# EAGLE board mbc_90_23_11_25_dc (EAGLE 7.6.0)
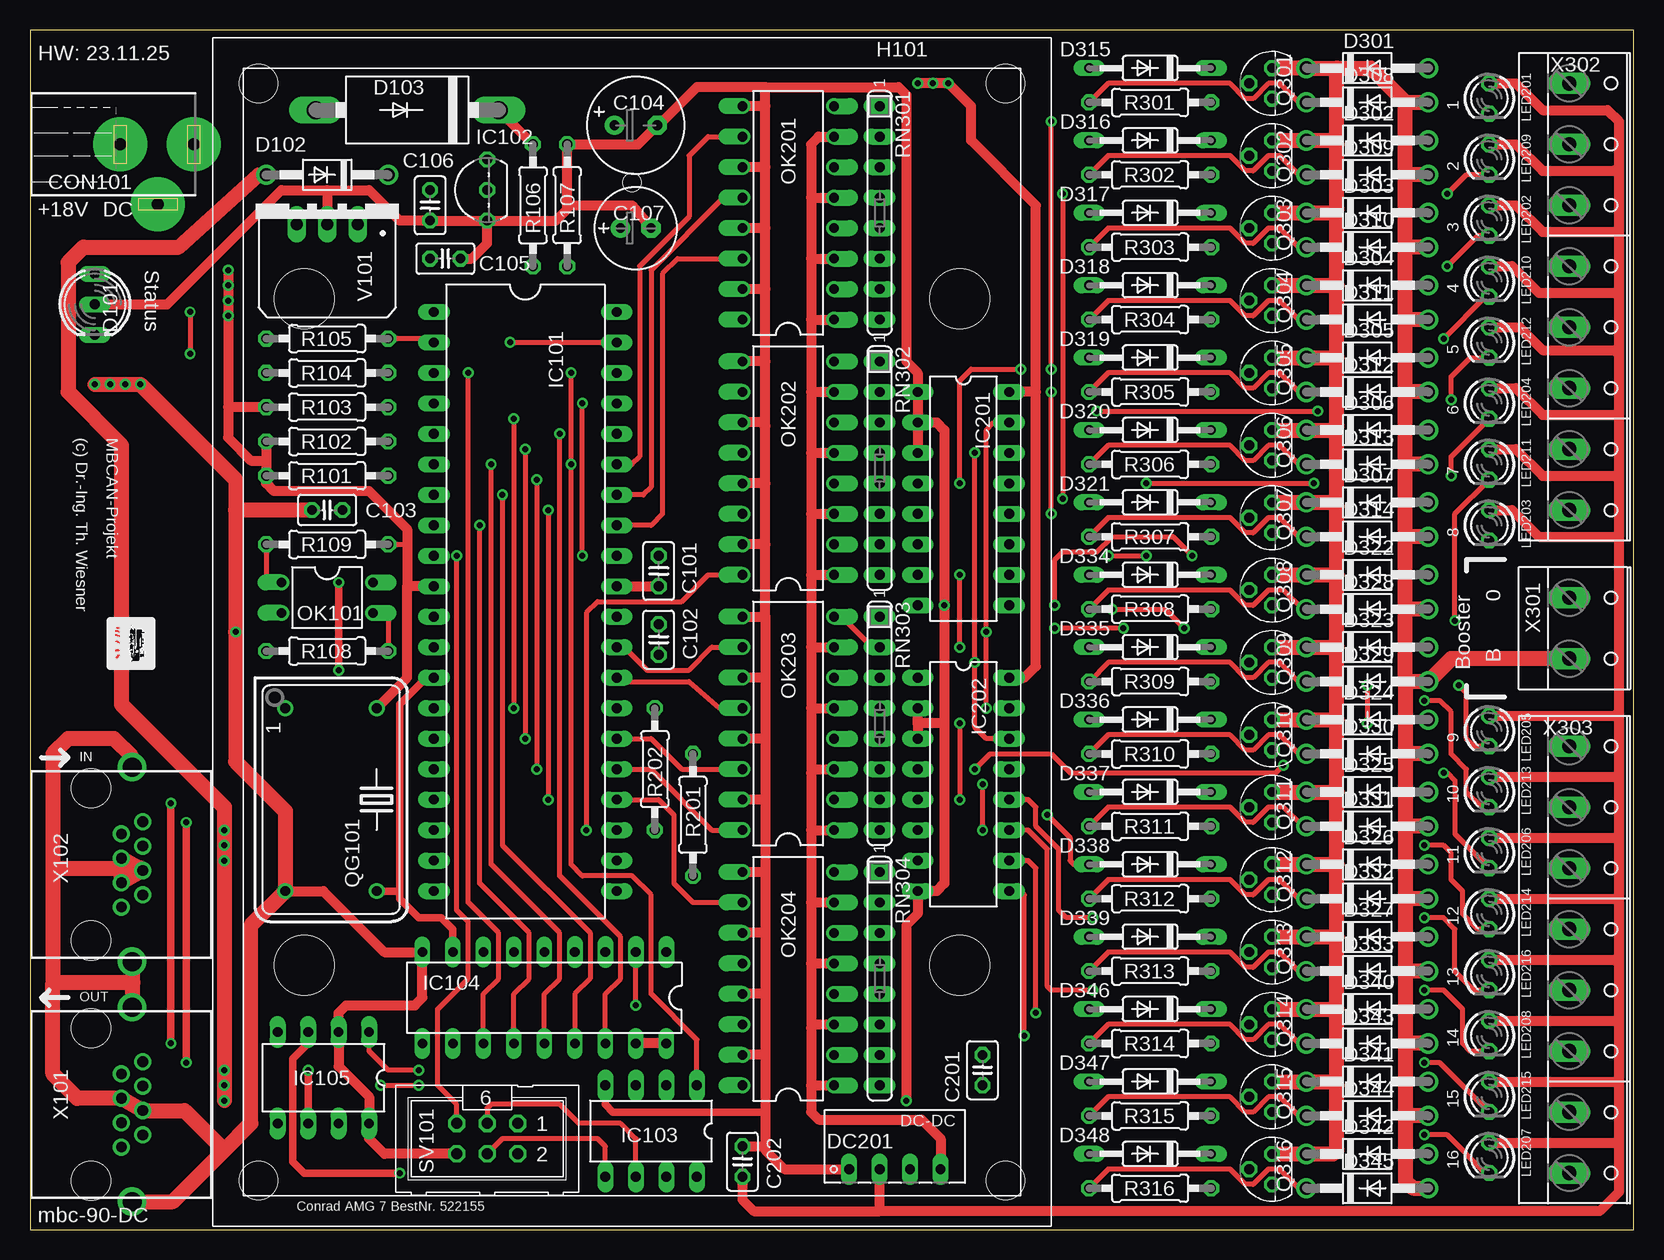
[diagram p3: board, top side]
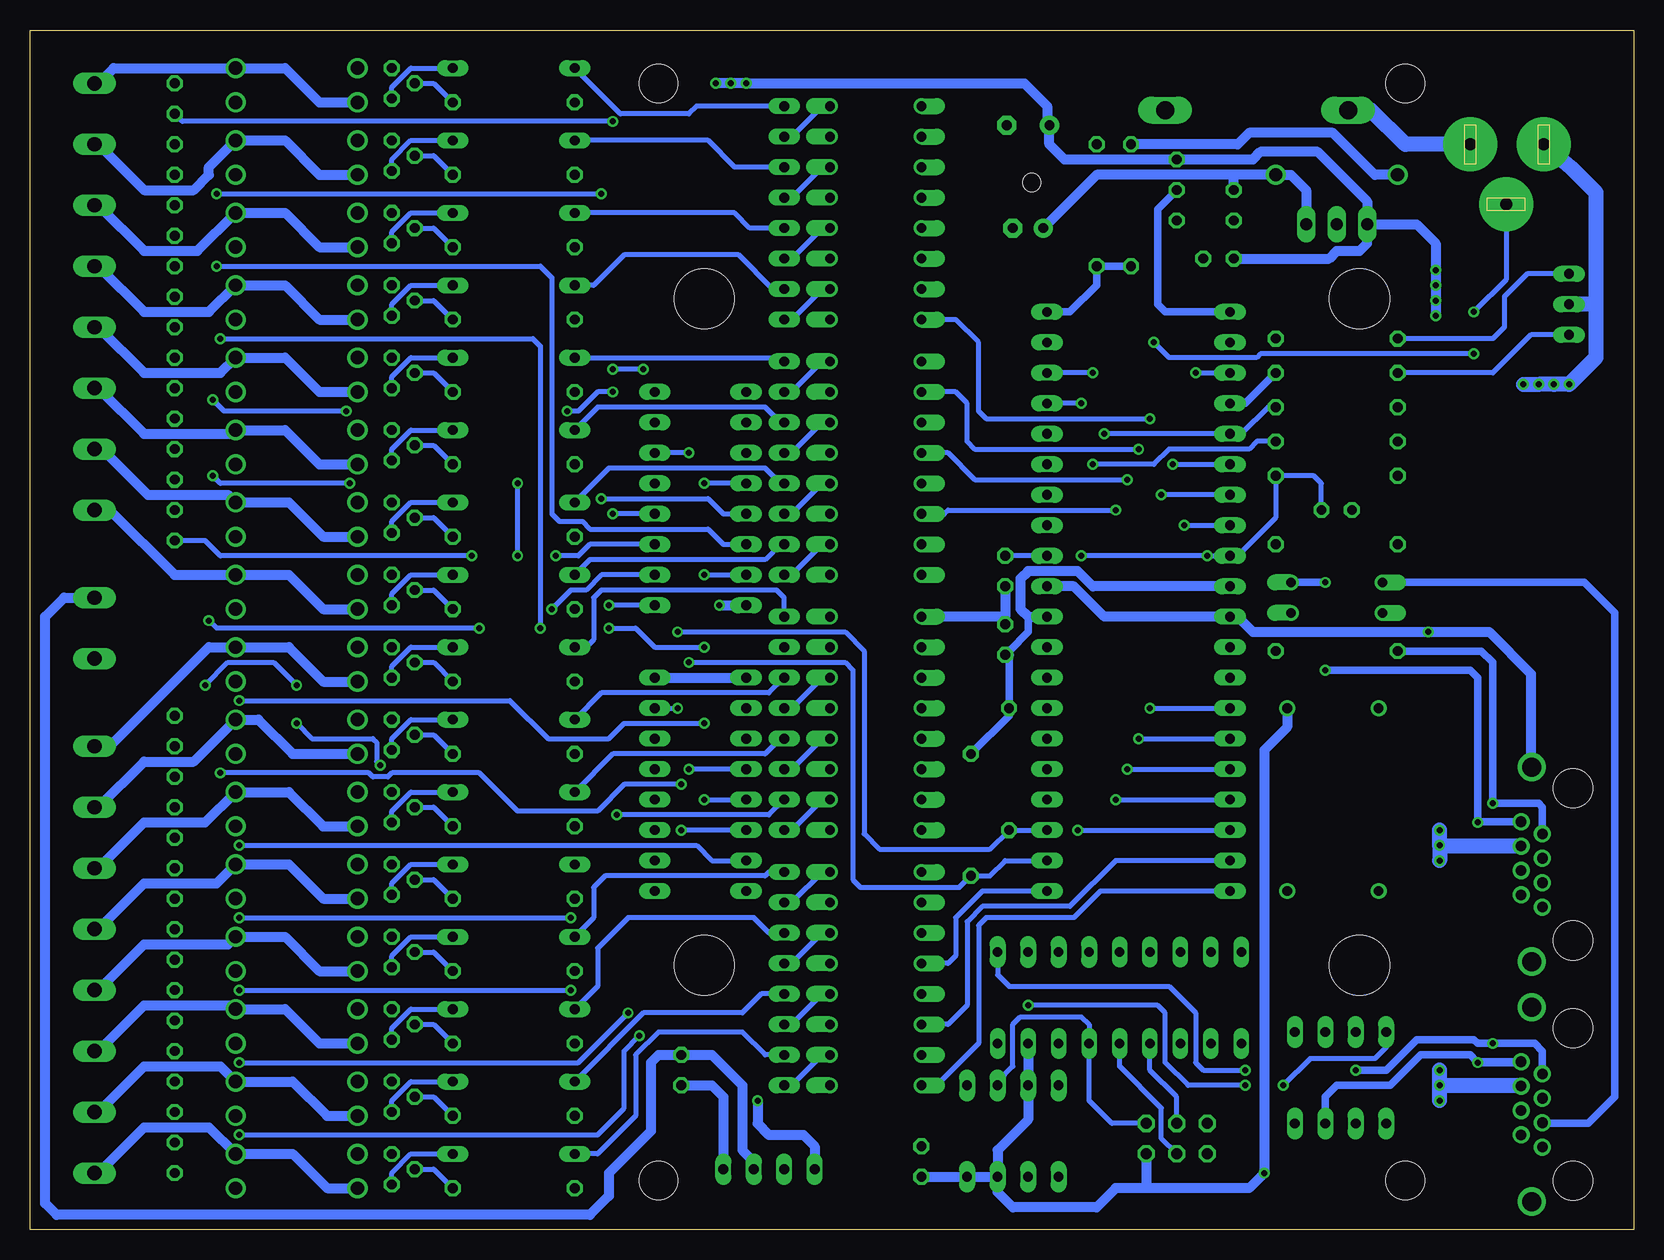
[diagram p4: board, bottom side, seen from below]

Size 133.66 x 99.99 mm. Coordinates in mm from the lower left corner, seen from the top.
Outline: 0,99.99 0,0 133.66,0 133.66,99.99 0,99.99
Copper layers (1*16): Top 0.035mm / dielectric 1.5mm / Bottom 0.035mm
Design rules "default *": minimum track width 10mil, minimum drill 0.5mm, track to track 8mil, track to pad 8mil, pad to pad 8mil, via to via 8mil, smd to smd 8mil, copper to edge 40mil, drill to drill 8mil, minimum pad ring 10mil, minimum via ring 8mil, stop-mask expansion 4mil, vias tented up to drill 0mil, thermal gap 10mil

## Footprints (pad centres in the part's own frame; a part is rotated, then mirrored left to right if it is on the bottom)
C025-025X050 = drill 0.813 octagon: 1 -1.27,0; 2 1.27,0
E3,5-8 = drill 0.813 pad 1.6: + -1.778,0 | drill 0.813 pad 1.6 octagon: - 1.778,0
E2,5-7 = drill 0.813 pad 1.6: + -1.27,0 | drill 0.813 pad 1.6 octagon: - 1.27,0
POWER-JACK = drill 1 pad 4.5: 1 0,6.03; 2 0,-0.12; 3 5,3.03
DUOLED5MM = drill 0.813 long: AG -2.54,0; AR 2.54,0; K 0,0
DO41-10 = drill 1.118: A 5.08,0; C -5.08,0
DO201-15 = drill 1.499 long: A 7.62,0; C -7.62,0
DO35-10 = drill 0.813 long: A 5.08,0; C -5.08,0
NME = drill 0.813 long: 1 0,3.81; 2 0,1.27; 3 0,-1.27; 4 0,-3.81
MODULGEHÄUSE-1 = hole 3.2: -45.72,-31.115; -45.72,31.115; 45.72,31.115; 45.72,-31.115 | hole 5: -27.781,-27.305; 27.781,-27.305; -27.781,27.305; 27.781,27.305 | hole 1.5: -37.465,0
DIL40 = drill 0.813 long: 1 -24.13,-7.62; 2 -21.59,-7.62; 3 -19.05,-7.62; 4 -16.51,-7.62; 5 -13.97,-7.62; 6 -11.43,-7.62; 7 -8.89,-7.62; 8 -6.35,-7.62; 9 -3.81,-7.62; 10 -1.27,-7.62; 11 1.27,-7.62; 12 3.81,-7.62; 13 6.35,-7.62; 14 8.89,-7.62; 15 11.43,-7.62; 16 13.97,-7.62; 17 16.51,-7.62; 18 19.05,-7.62; 19 21.59,-7.62; 20 24.13,-7.62; 21 24.13,7.62; 22 21.59,7.62; 23 19.05,7.62; 24 16.51,7.62; 25 13.97,7.62; 26 11.43,7.62; 27 8.89,7.62; 28 6.35,7.62; 29 3.81,7.62; 30 1.27,7.62; 31 -1.27,7.62; 32 -3.81,7.62; 33 -6.35,7.62; 34 -8.89,7.62; 35 -11.43,7.62; 36 -13.97,7.62; 37 -16.51,7.62; 38 -19.05,7.62; 39 -21.59,7.62; 40 -24.13,7.62
TO92- = drill 0.813 octagon: 1 -2.54,0; 2 0,0; 3 2.54,0
DIL8 = drill 0.813 long: 1 -3.81,-3.81; 2 -1.27,-3.81; 3 1.27,-3.81; 4 3.81,-3.81; 5 3.81,3.81; 6 1.27,3.81; 7 -1.27,3.81; 8 -3.81,3.81
DIL18 = drill 0.813 long: 1 -10.16,-3.81; 2 -7.62,-3.81; 3 -5.08,-3.81; 4 -2.54,-3.81 | drill 0.8 long: 5 0,-3.81; 6 2.54,-3.81; 7 5.08,-3.81; 8 7.62,-3.81; 9 10.16,-3.81; 10 10.16,3.81; 11 7.62,3.81; 12 5.08,3.81; 13 2.54,3.81; 14 0,3.81; 15 -2.54,3.81; 16 -5.08,3.81; 17 -7.62,3.81; 18 -10.16,3.81
DIL08 = drill 0.813 long: 1 -3.81,-3.81; 2 -1.27,-3.81; 3 1.27,-3.81; 4 3.81,-3.81; 5 3.81,3.81; 6 1.27,3.81; 7 -1.27,3.81; 8 -3.81,3.81
DIL16 = drill 0.813 long: 1 -8.89,-3.81; 2 -6.35,-3.81; 3 -3.81,-3.81; 4 -1.27,-3.81; 5 1.27,-3.81; 6 3.81,-3.81; 7 6.35,-3.81; 8 8.89,-3.81; 9 8.89,3.81; 10 6.35,3.81; 11 3.81,3.81; 12 1.27,3.81; 13 -1.27,3.81; 14 -3.81,3.81; 15 -6.35,3.81; 16 -8.89,3.81
LED3MM = drill 0.813 octagon: A -1.27,0; K 1.27,0
DIL04 = drill 0.813 offset: 1 -1.27,-3.81; 2 1.27,-3.81; 3 1.27,3.81; 4 -1.27,3.81
DIL16' = drill 0.813 offset: 1 -8.89,-3.81; 2 -6.35,-3.81; 3 -3.81,-3.81; 4 -1.27,-3.81; 5 1.27,-3.81; 6 3.81,-3.81; 7 6.35,-3.81; 8 8.89,-3.81; 9 8.89,3.81; 10 6.35,3.81; 11 3.81,3.81; 12 1.27,3.81; 13 -1.27,3.81; 14 -3.81,3.81; 15 -6.35,3.81; 16 -8.89,3.81
TO92 = drill 0.813 octagon: 1 1.27,0; 2 0,1.905; 3 -1.27,0
DIL14S = drill 0.813: 1 -7.62,-3.81; 7 7.62,-3.81; 8 7.62,3.81; 14 -7.62,3.81
0207/10 = drill 0.813 octagon: 1 -5.08,0; 2 5.08,0
SIL8 = drill 0.813 long: 1 -8.89,0; 2 -6.35,0; 3 -3.81,0; 4 -1.27,0; 5 1.27,0; 6 3.81,0; 7 6.35,0; 8 8.89,0
ML6 = drill 0.914 octagon: 1 -2.54,-1.27; 2 -2.54,1.27; 3 0,-1.27; 4 0,1.27; 5 2.54,-1.27; 6 2.54,1.27
TRACO-TSR-1 = drill 1.016 long: GND 0,2.54; IN -2.54,2.54; OUT 2.54,2.54
0446200002 = drill 0.889 pad 1.422: 1 3.556,2.54; 2 2.54,4.318; 3 1.524,2.54; 4 0.508,4.318; 5 -0.508,2.54; 6 -1.524,4.318; 7 -2.54,2.54; 8 -3.556,4.318 | drill 1.575 pad 2.286: S@1 -8.103,3.429; S@2 8.103,3.429 | hole 3.251: 6.35,0; -6.35,0
W237-132 = drill 1.194 long: 1 -2.54,-0.635; 2 2.54,-0.635
W237-8P = drill 1.194 long: 1 -17.78,-0.635; 2 -12.7,-0.635; 3 -7.62,-0.635; 4 -2.54,-0.635; 5 2.54,-0.635; 6 7.62,-0.635; 7 12.7,-0.635; 8 17.78,-0.635

## Placement (x,y rotation side)
C101  100n  [C025-025X050]  52.39,54.91 270 top
C102  100n  [C025-025X050]  52.39,49.19 90 top
C103  100n  [C025-025X050]  24.77,59.99 180 top
C104  470u/16V  [E3,5-8]  50.48,92.06 0 top
C105  100n  [C025-025X050]  34.61,80.94 0 top
C106  100n  [C025-025X050]  33.34,85.39 270 top
C107  47u/35V  [E2,5-7]  50.48,83.48 0 top
C201  100n  [C025-025X050]  79.38,13.32 90 top
C202  100n  [C025-025X050]  59.37,5.7 90 top
CON101  [POWER-JACK]  7.62,90.47 270 top
D101  Status  [DUOLED5MM]  5.4,77.13 270 top
D102  1N4004  [DO41-10]  24.77,87.93 180 top
D103  1N5400  [DO201-15]  31.43,93.33 180 top
D301  1N4001  [DO41-10]  111.44,96.82 0 top
D302  1N4001  [DO41-10]  111.44,90.79 0 top
D303  1N4001  [DO41-10]  111.44,84.75 0 top
D304  1N4001  [DO41-10]  111.44,78.72 0 top
D305  1N4001  [DO41-10]  111.44,72.69 0 top
D306  1N4001  [DO41-10]  111.44,66.66 0 top
D307  1N4001  [DO41-10]  111.44,60.62 0 top
D308  1N4001  [DO41-10]  111.44,93.96 0 top
D309  1N4001  [DO41-10]  111.44,87.93 0 top
D310  1N4001  [DO41-10]  111.44,81.9 0 top
D311  1N4001  [DO41-10]  111.44,75.86 0 top
D312  1N4001  [DO41-10]  111.44,69.83 0 top
D313  1N4001  [DO41-10]  111.44,63.8 0 top
D314  1N4001  [DO41-10]  111.44,57.76 0 top
D315  1N4148  [DO35-10]  93.34,96.82 180 top
D316  1N4148  [DO35-10]  93.34,90.79 180 top
D317  1N4148  [DO35-10]  93.34,84.75 180 top
D318  1N4148  [DO35-10]  93.34,78.72 180 top
D319  1N4148  [DO35-10]  93.34,72.69 180 top
D320  1N4148  [DO35-10]  93.34,66.66 180 top
D321  1N4148  [DO35-10]  93.34,60.62 180 top
D322  1N4001  [DO41-10]  111.44,54.59 0 top
D323  1N4001  [DO41-10]  111.44,48.56 0 top
D324  1N4001  [DO41-10]  111.44,42.52 0 top
D325  1N4001  [DO41-10]  111.44,36.49 0 top
D326  1N4001  [DO41-10]  111.44,30.46 0 top
D327  1N4001  [DO41-10]  111.44,24.43 0 top
D328  1N4001  [DO41-10]  111.44,51.73 0 top
D329  1N4001  [DO41-10]  111.44,45.7 0 top
D330  1N4001  [DO41-10]  111.44,39.67 0 top
D331  1N4001  [DO41-10]  111.44,33.63 0 top
D332  1N4001  [DO41-10]  111.44,27.6 0 top
D333  1N4001  [DO41-10]  111.44,21.57 0 top
D334  1N4148  [DO35-10]  93.34,54.59 180 top
D335  1N4148  [DO35-10]  93.34,48.56 180 top
D336  1N4148  [DO35-10]  93.34,42.52 180 top
D337  1N4148  [DO35-10]  93.34,36.49 180 top
D338  1N4148  [DO35-10]  93.34,30.46 180 top
D339  1N4148  [DO35-10]  93.34,24.43 180 top
D340  1N4001  [DO41-10]  111.44,18.39 0 top
D341  1N4001  [DO41-10]  111.44,12.36 0 top
D342  1N4001  [DO41-10]  111.44,6.33 0 top
D343  1N4001  [DO41-10]  111.44,15.54 0 top
D344  1N4001  [DO41-10]  111.44,9.51 0 top
D345  1N4001  [DO41-10]  111.44,3.47 0 top
D346  1N4148  [DO35-10]  93.34,18.39 180 top
D347  1N4148  [DO35-10]  93.34,12.36 180 top
D348  1N4148  [DO35-10]  93.34,6.33 180 top
DC201  NKE0505  [NME]  72.07,5.06 90 top
H101  [MODULGEHÄUSE-1]  50.16,49.83 270 top
IC101  MEGA644-P  [DIL40]  41.27,52.37 270 top
IC102  DS1820  [TO92-]  38.1,86.66 90 top
IC103  25LC10240P  [DIL8]  51.75,8.24 180 top
IC104  MCP2515-I/P  [DIL18]  42.86,19.35 180 top
IC105  PCA82C250  [DIL08]  24.45,12.68 180 top
IC201  PCF8574P  [DIL16]  77.79,60.94 270 top
IC202  PCF8574P  [DIL16]  77.79,37.13 270 top
LED201  Gelb 5V 3mm  [LED3MM]  121.6,94.28 270 top
LED202  Gelb 5V 3mm  [LED3MM]  121.6,84.12 270 top
LED203  Gelb 5V 3mm  [LED3MM]  121.6,58.72 270 top
LED204  Gelb 5V 3mm  [LED3MM]  121.6,68.88 270 top
LED205  Gelb 5V 3mm  [LED3MM]  121.6,41.57 270 top
LED206  Gelb 5V 3mm  [LED3MM]  121.6,31.41 270 top
LED207  Gelb 5V 3mm  [LED3MM]  121.6,6.01 270 top
LED208  Gelb 5V 3mm  [LED3MM]  121.6,16.17 270 top
LED209  Gelb 5V 3mm  [LED3MM]  121.6,89.2 270 top
LED210  Gelb 5V 3mm  [LED3MM]  121.6,79.04 270 top
LED211  Gelb 5V 3mm  [LED3MM]  121.6,63.8 270 top
LED212  Gelb 5V 3mm  [LED3MM]  121.6,73.96 270 top
LED213  Gelb 5V 3mm  [LED3MM]  121.6,36.49 270 top
LED214  Gelb 5V 3mm  [LED3MM]  121.6,26.33 270 top
LED215  Gelb 5V 3mm  [LED3MM]  121.6,11.09 270 top
LED216  Gelb 5V 3mm  [LED3MM]  121.6,21.25 270 top
OK101  PC814  [DIL04]  24.77,52.68 270 top
OK201  PC 847X  [DIL16']  63.18,84.75 90 top
OK202  PC 847X  [DIL16']  63.18,63.48 90 top
OK203  PC 847X  [DIL16']  63.18,42.21 90 top
OK204  PC 847X  [DIL16']  63.18,20.93 90 top
Q301  BC547A  [TO92]  103.5,95.55 90 top
Q302  BC547A  [TO92]  103.5,89.52 90 top
Q303  BC547A  [TO92]  103.5,83.48 90 top
Q304  BC547A  [TO92]  103.5,77.45 90 top
Q305  BC547A  [TO92]  103.5,71.42 90 top
Q306  BC547A  [TO92]  103.5,65.39 90 top
Q307  BC547A  [TO92]  103.5,59.35 90 top
Q308  BC547A  [TO92]  103.5,53.32 90 top
Q309  BC547A  [TO92]  103.5,47.29 90 top
Q310  BC547A  [TO92]  103.5,41.25 90 top
Q311  BC547A  [TO92]  103.5,35.22 90 top
Q312  BC547A  [TO92]  103.5,29.19 90 top
Q313  BC547A  [TO92]  103.5,23.16 90 top
Q314  BC547A  [TO92]  103.5,17.12 90 top
Q315  BC547A  [TO92]  103.5,11.09 90 top
Q316  BC547A  [TO92]  103.5,5.06 90 top
QG101  16 MHz  [DIL14S]  25.08,35.86 270 top
R101  10k  [0207/10]  24.77,62.84 180 top
R102  10k  [0207/10]  24.77,65.7 180 top
R103  10k  [0207/10]  24.77,68.56 180 top
R104  390R  [0207/10]  24.77,71.42 180 top
R105  390R  [0207/10]  24.77,74.28 180 top
R106  9k/0,1%  [0207/10]  41.91,85.39 270 top
R107  1k/0,1%  [0207/10]  44.77,85.39 90 top
R108  120R  [0207/10]  24.77,48.24 180 top
R109  390R  [0207/10]  24.77,57.13 180 top
R201  4k7  [0207/10]  55.24,34.59 90 top
R202  4k7  [0207/10]  52.07,38.4 90 top
R301  1k  [0207/10]  93.34,93.96 0 top
R302  1k  [0207/10]  93.34,87.93 0 top
R303  1k  [0207/10]  93.34,81.9 0 top
R304  1k  [0207/10]  93.34,75.86 0 top
R305  1k  [0207/10]  93.34,69.83 0 top
R306  1k  [0207/10]  93.34,63.8 0 top
R307  1k  [0207/10]  93.34,57.76 0 top
R308  1k  [0207/10]  93.34,51.73 0 top
R309  1k  [0207/10]  93.34,45.7 0 top
R310  1k  [0207/10]  93.34,39.67 0 top
R311  1k  [0207/10]  93.34,33.63 0 top
R312  1k  [0207/10]  93.34,27.6 0 top
R313  1k  [0207/10]  93.34,21.57 0 top
R314  1k  [0207/10]  93.34,15.54 0 top
R315  1k  [0207/10]  93.34,9.51 0 top
R316  1k  [0207/10]  93.34,3.47 0 top
RN301  10k  [SIL8]  70.8,84.75 270 top
RN302  10k  [SIL8]  70.8,63.48 270 top
RN303  10k  [SIL8]  70.8,42.21 270 top
RN304  10k  [SIL8]  70.8,20.93 270 top
SV101  [ML6]  38.1,7.6 180 top
V101  TSR-1  [TRACO-TSR-1]  24.77,86.34 180 top
X101  OUT  [0446200002]  5.08,10.46 270 top
X102  IN  [0446200002]  5.08,30.46 270 top
X301  [W237-132]  128.91,50.14 270 top
X302  [W237-8P]  128.91,77.77 270 top
X303  [W237-8P]  128.91,22.52 270 top

## Tracks (layer width: path | path; a pad name or v marks a point on that pad's centre or on a via)
1-WIRE
  Bottom 0.61: IC102.2 39.69,85.07 39.69,77.13 39.05,76.5 IC101.1
+5V  (via drill 0.5)
  Top 0.406: R109.1 31.43,57.13
  Top 0.61: IC105.3 23.18,15.54 21.91,14.27 21.91,5.7 22.86,4.74 v30.8,4.74
  Top 0.813: IC104.18 IC104.17 | 31.43,53.64 31.43,57.13 31.43,58.4 28.26,61.57 20.32,61.57 19.68,62.21 R101.2 19.68,64.12 | v16.51,79.99 v16.51,78.72 v16.51,77.45 v16.51,76.18 16.51,68.56 | 16.51,68.56 16.51,66.02 18.41,64.12 19.68,64.12 | IC101.10 31.43,53.64 | QG101.14 31.43,46.02 31.43,53.64 | R103.2 16.51,68.56 | R102.2 19.68,64.12 | LED201.A 123.83,95.55 126.05,93.33 131.44,93.33 132.4,92.37 132.4,88.56 | 132.4,88.56 132.4,83.17 | 132.4,83.17 132.4,77.77 | 132.4,77.77 132.4,73.01 | 132.4,73.01 132.4,67.92 | 132.4,67.92 132.4,62.53 | 132.4,62.53 132.4,57.76 | 132.4,57.76 132.4,43.16 | 132.4,43.16 132.4,37.76 | 132.4,37.76 132.4,32.68 | 132.4,32.68 132.4,27.6 | 132.4,27.6 132.4,22.21 | 132.4,22.21 132.4,17.44 | 132.4,17.44 132.4,12.36 | 132.4,12.36 132.4,7.28 | 132.4,7.28 132.4,3.15 130.81,1.57 70.8,1.57 | 70.8,1.57 DC201.2 | C202.1 59.37,2.52 60.33,1.57 70.8,1.57 | LED207.A 132.4,7.28 | LED215.A 132.4,12.36 | LED208.A 132.4,17.44 | LED216.A 132.08,22.52 132.4,22.21 | LED214.A 132.4,27.6 | LED206.A 132.4,32.68 | LED213.A 132.4,37.76 | LED205.A 132.08,42.84 132.4,43.16 | LED203.A 123.51,59.99 125.73,57.76 132.4,57.76 | LED211.A 123.83,65.07 126.05,62.84 132.08,62.84 132.4,62.53 | LED204.A 123.83,70.15 126.05,67.92 132.4,67.92 | LED212.A 124.14,75.23 126.05,73.32 132.08,73.32 132.4,73.01 | LED210.A 123.51,80.31 125.73,78.09 132.08,78.09 132.4,77.77 | LED202.A 123.83,85.39 126.05,83.17 132.4,83.17 | LED209.A 123.83,90.47 126.05,88.25 132.08,88.25 132.4,88.56 | IC202.16 82.87,46.02 83.82,46.97 83.82,69.83 | 83.82,69.83 IC201.16 | 83.82,69.83 83.82,85.39 78.42,90.79 78.42,93.64 v76.52,95.55 v75.25,95.55 v73.98,95.55
  Bottom 0.406: 48.9,92.06 C104.+
  Bottom 0.61: 50.48,51.1 50.48,49.83 52.07,48.24 52.07,47.92 R202.2 52.07,42.84 R201.2
  Bottom 0.813: V101.OUT 18.1,83.8 16.51,82.21 v16.51,79.99 v16.51,78.72 v16.51,77.45 v16.51,76.18 | QG101.14 28.89,41.89 30.8,39.98 v30.8,4.74 32.07,3.47 40.64,3.47 | IC101.10 45.09,53.64 46.35,54.91 50.48,54.91 51.12,54.27 51.12,51.73 50.48,51.1 IC101.30 | V101.OUT 22.23,85.7 26.35,89.83 31.11,89.83 31.75,89.2 IC102.3 47.43,89.2 48.7,90.47 C104.+ | IC202.16 IC202.1 | IC104.17 IC103.3 50.48,9.19 53.02,6.65 IC103.7 | C202.1 IC103.8 IC103.7 | 40.64,3.47 43.18,3.47 44.77,1.89 51.75,1.89 53.02,3.15 IC103.7 | SV101.2 40.64,3.47 | C105.1 25.4,80.94 24.77,81.58 22.86,81.58 22.23,82.21 V101.OUT | C102.1 52.07,47.92 | 48.9,92.06 48.9,93.64 50.8,95.55 v73.98,95.55 v76.52,95.55
+18V  (via drill 0.5)
  Top 0.813: R106.1 D103.C
  Top 1.27: D102.A 19.05,87.93 12.38,81.9 4.45,81.9 3.17,80.62 3.17,69.83 7.62,65.39 7.62,43.79 16.19,35.22 v16.19,33.32 v16.19,32.05 v16.19,30.78 v16.19,13.32 v16.19,12.04 v16.19,10.78
  Bottom 0.813: R106.1 33.02,90.47 32.07,91.42 25.08,91.42 21.59,87.93 D102.A
  Bottom 1.27: v16.19,12.04 9.46,12.04 X101.6 | v16.19,10.78 v16.19,12.04 | v16.19,12.04 v16.19,13.32 | X102.6 16.13,31.98 v16.19,32.05 | v16.19,32.05 v16.19,33.32 | v16.19,32.05 v16.19,30.78
/CS-MBC  (via drill 0.5)
  Top 0.406: IC104.16 47.94,19.66 49.21,20.93 49.21,24.43 44.13,29.51 v44.13,66.34
  Bottom 0.406: R103.1 30.48,68.56 32.7,66.34 IC101.5 v44.13,66.34
/CS-MEM  (via drill 0.5)
  Top 0.406: IC103.1 55.56,15.86 51.75,19.66 51.75,27.92 50.16,29.51 46.04,29.51 45.09,30.46 v45.09,63.8 v45.09,71.42
  Bottom 0.406: v45.09,71.42 IC101.38 | R102.1 31.43,65.7 32.07,65.07 38.73,65.07 40.01,63.8 v45.09,63.8
/INT  (via drill 0.5)
  Top 0.406: IC104.12 37.78,19.66 39.05,20.93 39.05,24.75 36.51,27.29 v36.51,71.42
  Bottom 0.406: v36.51,71.42 IC101.3
/RES  (via drill 0.5)
  Top 0.406: SV101.5 35.56,10.46 33.97,12.04 33.97,18.39 36.51,20.93 36.51,25.7 35.56,26.65 v35.56,56.18 | v46.04,56.18 v46.04,68.88
  Bottom 0.406: C103.1 26.04,62.21 26.67,62.84 R101.1 29.84,59.35 33.02,56.18 IC101.9 v35.56,56.18 v46.04,56.18 | v46.04,68.88 IC101.37
AREF
  Bottom 0.406: IC101.32 C101.1
CAN-H  (via drill 0.5)
  Top 0.61: v13.02,13.95 v13.02,33.95 | v25.72,46.65 v25.72,53.95
  Bottom 0.61: IC105.7 25.72,11.09 24.77,12.04 20.32,12.04 17.78,14.59 13.65,14.59 13.08,14.01 X101.8 9.46,14.01 9.53,13.95 v13.02,13.95 | v13.02,33.95 13.02,34.02 | 13.02,34.02 X102.8 | 13.02,34.02 13.02,46.02 13.65,46.65 v25.72,46.65 | v25.72,53.95 OK101.4
CAN-L  (via drill 0.5)
  Top 0.61: v23.18,13.32 IC105.6 | v11.75,15.54 v11.75,35.54
  Bottom 0.61: X101.7 7.62,14.9 8.26,15.54 v11.75,15.54 13.02,15.54 13.34,15.86 18.1,15.86 20.64,13.32 v23.18,13.32 | X102.7 7.62,35.22 7.94,35.54 v11.75,35.54 11.75,47.29 12.7,48.24 R108.2
GND  (via drill 0.5)
  Top 0.406: 52.39,92.06 C104.-
  Top 0.61: IC103.4 47.94,10.46 48.58,9.82 61.28,9.82
  Top 0.813: IC101.31 C101.2 | C104.- 50.67,90.47 R107.2 44.77,85.39 | 44.77,85.39 44.77,85.07 43.81,84.12 IC102.1 | 24.77,86.66 V101.GND | 24.77,86.66 28.26,86.66 30.8,84.12 C106.2 IC102.1 | D101.K 11.43,77.13 20.95,86.66 24.77,86.66 | 73.98,42.21 IC202.2 | 73.98,42.21 IC202.3 | IC201.2 IC201.3 | 61.28,93.64 OK201.9 | 61.28,88.56 61.28,93.64 | 61.28,83.48 61.28,88.56 | 61.28,78.4 61.28,83.48 | 61.28,72.37 61.28,78.4 | 61.28,66.97 61.28,72.37 | 61.28,62.21 61.28,66.97 | 61.28,57.13 61.28,62.21 | 61.28,51.1 61.28,57.13 | 61.28,51.1 61.28,46.02 | 61.28,46.02 61.28,40.94 | 61.28,40.94 61.28,35.86 | 61.28,24.75 61.28,19.66 | 61.28,19.66 61.28,14.59 | 61.28,14.59 OK204.15 | 61.28,19.66 OK204.13 | 61.28,24.75 OK204.11 | 61.28,29.82 OK204.9 | 61.28,29.82 61.28,24.75 | 61.28,35.86 OK203.15 | 61.28,35.86 61.28,29.82 | 61.28,40.94 OK203.13 | 61.28,46.02 OK203.11 | OK203.9 61.28,51.1 | 61.28,88.56 OK201.11 | 61.28,83.48 OK201.13 | 61.28,78.4 OK201.15 | 61.28,72.37 OK202.9 | OK202.11 60.96,67.29 61.28,66.97 | 61.28,62.21 OK202.13 | 61.28,57.13 OK202.15 | IC201.2 IC201.1 73.98,71.42 73.03,72.37 73.03,94.59 72.39,95.23 61.28,95.23 | 76.2,42.21 v76.2,52.05 76.2,66.66 75.56,67.29 IC201.2 | 76.2,42.21 73.98,42.21 | 61.28,93.64 61.28,95.23 | 61.28,95.23 55.56,95.23 52.39,92.06 | 76.2,42.21 76.2,28.87 75.56,28.24 IC202.8 73.98,26.33 73.03,25.38 v73.03,10.78 | C107.- 50.16,85.39 44.77,85.39 | 61.28,14.59 61.28,9.82 61.28,6.97 | 61.28,6.97 61.28,6.65 62.87,5.06 DC201.1 | SV101.6 29.53,6.33 28.26,7.6 IC105.8 28.26,11.09 25.72,13.63 IC105.2 25.72,18.08 26.35,18.71 32.07,18.71 32.7,19.35 IC104.9 29.53,23.16 24.45,28.24 QG101.7 | C105.2 36.83,80.94 38.1,82.21 IC102.1
  Top 0.813: C202.2 61.28,6.97
  Top 1.27: v5.4,70.47 v9.21,70.47 17.14,62.53 17.14,59.99 | 17.14,59.99 v17.14,49.83 17.14,39.03 21.27,34.9 QG101.7 18.41,25.38 18.41,8.87 16.19,6.65 | C103.2 17.14,59.99 | X101.S@2 11.9,2.35 16.19,6.65 | 16.19,6.65 12.89,9.95 X101.4 X101.5 3.94,10.97 1.91,13 1.91,20.62 | X102.4 X102.3 7.62,30.14 | X102.4 X102.5 | X101.S@1 X102.S@2 8.51,20.68 8.57,20.62 1.91,20.62 | 1.91,30.14 7.62,30.14 | 7.62,30.14 9.21,30.14 X102.4 | X102.S@1 8.51,39.41 6.99,40.94 3.17,40.94 1.91,39.67 1.91,30.14 | 1.91,30.14 1.91,20.62
  Bottom 0.813: IC101.31 46.67,53.64 44.13,51.1 IC101.11 33.02,51.1 31.75,49.83 v17.14,49.83 12.06,49.83 8.57,46.33 8.57,38.4 | v76.2,52.05 IC201.8 | 52.39,51.1 OK203.9 | C101.2 52.39,51.1 | v73.03,10.78 73.03,8.87 72.07,7.92 69.22,7.92 68.26,6.97 DC201.1 | C102.2 52.39,51.1
  Bottom 1.27: 3.17,77.13 3.17,86.46 5.28,88.56 CON101.2 | 3.17,77.13 D101.K | 3.17,77.13 3.17,72.69 v5.4,70.47 v6.67,70.47 v7.94,70.47 v9.21,70.47
GNDA
  Bottom 0.813: DC201.3 73.34,5.7 74.3,6.65 74.3,12.04 76.83,14.59 C201.2 81.28,14.59 81.92,13.95 81.92,8.24 85.41,4.74 85.41,2.84 87,1.25 131.44,1.25 132.4,2.2 132.4,51.1 130.81,52.68 X301.1
I00
  Top 0.406: IC101.35 50.16,63.8 50.8,64.43 50.8,80.31 54.93,84.44 54.93,89.52 56.52,91.1 OK201.10
I01
  Top 0.406: IC101.34 51.12,61.26 51.75,61.89 51.75,79.99 57.78,86.02 OK201.12
I02
  Top 0.406: IC101.33 51.75,58.72 52.7,59.67 52.7,79.67 53.98,80.94 OK201.14
I03  (via drill 0.5)
  Top 0.406: v40.32,67.61 v40.32,43.48
  Bottom 0.406: v40.32,43.48 IC101.14 | v40.32,67.61 53.98,67.61 54.61,68.24 54.61,73.96 56.52,75.86 OK201.16
I04  (via drill 0.5)
  Top 0.406: v41.27,65.07 v41.27,40.94
  Bottom 0.406: v41.27,40.94 IC101.15 | v41.27,65.07 54.93,65.07 55.56,65.7 55.56,68.88 56.52,69.83 OK202.10
I05  (via drill 0.5)
  Top 0.406: v42.23,62.53 v42.23,38.4
  Bottom 0.406: v42.23,38.4 IC101.16 | v42.23,62.53 54.93,62.53 57.15,64.75 OK202.12
I06  (via drill 0.5)
  Top 0.406: v43.18,59.99 v43.18,35.86
  Bottom 0.406: v43.18,35.86 IC101.17 | v43.18,59.99 57.15,59.99 57.47,59.67 OK202.14
I07  (via drill 0.5)
  Top 0.406: v46.35,33.32 46.35,51.41 47.31,52.37 54.29,52.37 56.52,54.59 OK202.16
  Bottom 0.406: v46.35,33.32 IC101.18
I08
  Top 0.406: IC101.29 49.53,48.56 51.44,46.65 54.93,46.65 56.83,48.56 OK203.10
I09
  Top 0.406: IC101.28 49.21,46.02 49.53,45.7 54.93,45.7 57.47,43.48 OK203.12
I10
  Top 0.406: IC101.26 51.75,40.94 54.29,38.4 OK203.14
I11
  Top 0.406: IC101.25 51.75,38.4 56.83,33.32 OK203.16
I12
  Top 0.406: IC101.24 52.39,35.86 53.66,34.59 53.66,28.87 55.24,27.29 OK204.10
I13
  Bottom 0.406: IC101.21 54.29,28.24 56.52,26.02 56.52,22.84 57.15,22.21 OK204.12
I14
  Bottom 0.406: IC101.19 43.18,30.78 46.99,26.97 54.29,26.97 55.56,25.7 55.56,18.71 57.15,17.12 OK204.14
I15
  Bottom 0.406: IC101.20 44.45,28.24 46.67,26.02 53.98,26.02 54.61,25.38 54.61,15.54 58.1,12.04 OK204.16
IN
  Top 1.27: X301.2 118.43,47.6 D329.A 114.62,45.7 | 114.62,45.7 114.62,51.73 | 114.62,51.73 114.62,57.76 | 114.62,57.76 114.62,63.8 | 114.62,63.8 114.62,69.51 | 114.62,69.51 114.62,75.86 | 114.62,75.86 114.62,81.9 | 114.62,81.9 114.62,87.93 | 114.62,87.93 114.62,93.96 | 114.62,93.96 D308.A | 108.9,96.82 D301.C Q301.1 | 108.9,96.82 111.76,96.82 114.62,93.96 | D309.A 114.62,87.93 | D310.A 114.62,81.9 | D311.A 114.62,75.86 | D312.A 114.94,69.83 114.62,69.51 | D313.A 114.62,63.8 | D314.A 114.62,57.76 | D328.A 114.62,51.73 | 114.62,45.7 114.62,39.67 | 114.62,39.67 114.62,33.63 | D330.A 114.62,39.67 | D331.A 114.62,33.63 | 114.62,33.63 114.62,27.6 | 114.62,27.6 114.62,21.57 | 114.62,21.57 114.62,15.54 | 114.62,15.54 114.62,9.51 | 114.62,9.51 114.62,4.11 115.25,3.47 D345.A | D344.A 114.62,9.51 | D343.A 114.62,15.54 | D333.A 114.62,21.57 | D332.A 114.62,27.6 | Q302.1 D302.C 108.58,90.79 108.9,90.47 | Q303.1 D303.C 108.58,84.75 108.9,85.07 | Q304.1 D304.C 108.9,78.72 | Q305.1 D305.C 108.9,72.69 | Q306.1 D306.C 108.58,66.66 108.9,66.97 | Q307.1 D307.C 108.58,60.62 108.9,60.3 | Q308.1 D322.C 108.9,54.59 | Q309.1 D323.C 108.9,48.56 | Q310.1 D324.C 108.9,42.52 | Q311.1 D325.C 108.9,36.49 | Q312.1 D326.C 108.9,30.46 | Q313.1 D327.C 108.9,24.43 | Q314.1 D340.C 108.9,18.39 | D341.C Q315.1 108.58,12.36 108.9,12.04 | Q316.1 D342.C 108.58,6.33 108.9,6.65 108.9,12.04 | 108.9,12.04 108.9,18.39 | 108.9,18.39 108.9,24.43 | 108.9,24.43 108.9,30.46 | 108.9,30.46 108.9,36.49 | 108.9,36.49 108.9,42.52 | 108.9,42.52 108.9,48.56 | 108.9,48.56 108.9,54.59 | 108.9,54.59 108.9,60.3 | 108.9,60.3 108.9,66.97 | 108.9,66.97 108.9,72.69 | 108.9,72.69 108.9,78.72 | 108.9,78.72 108.9,85.07 | 108.9,85.07 108.9,90.47
  Top 1.27: 108.9,90.47 108.9,96.82
IN0
  Bottom 0.406: OK201.8 67.63,93.64 70.17,91.1 RN301.2
IN1
  Bottom 0.406: OK201.6 67.63,88.56 70.17,86.02 RN301.4
IN2
  Bottom 0.406: OK201.4 67.63,83.48 70.17,80.94 RN301.6
IN3
  Bottom 0.406: OK201.2 67.63,78.4 70.17,75.86 RN301.8
IN4
  Bottom 0.406: OK202.8 67.63,72.37 70.17,69.83 RN302.2
IN5
  Bottom 0.406: OK202.6 67.63,67.29 70.17,64.75 RN302.4
IN6
  Bottom 0.406: OK202.4 67.63,62.21 70.17,59.67 RN302.6
IN7
  Bottom 0.406: OK202.2 67.63,57.13 70.17,54.59 RN302.8
IN8
  Top 0.406: OK203.8 67.63,51.1 70.17,48.56 RN303.2
IN9
  Bottom 0.406: OK203.6 67.63,46.02 70.17,43.48 RN303.4
IN10
  Bottom 0.406: OK203.4 67.63,40.94 70.17,38.4 RN303.6
IN11
  Bottom 0.406: OK203.2 67.63,35.86 70.17,33.32 RN303.8
IN12
  Bottom 0.406: OK204.8 67.63,29.82 70.17,27.29 RN304.2
IN13
  Bottom 0.406: OK204.6 67.63,24.75 70.17,22.21 RN304.4
IN14
  Bottom 0.406: OK204.4 67.63,19.66 70.17,17.12 RN304.6
IN15
  Bottom 0.406: OK204.2 67.63,14.59 70.17,12.04 RN304.8
LED-G
  Top 0.406: IC101.2 32.7,74.28 R105.1
LED-R
  Bottom 0.61: IC101.4 32.38,68.88 R104.1
MISO  (via drill 0.5)
  Top 0.406: v39.37,61.26 39.37,32.05 46.67,24.75 46.67,20.93 45.4,19.66 IC104.15
  Bottom 0.406: SV101.1 43.5,8.87 45.4,10.78 IC104.15 45.4,17.12 46.04,17.76 51.12,17.76 51.75,17.12 51.75,13.63 53.02,12.36 IC103.2 | IC101.7 v39.37,61.26
MOSI  (via drill 0.5)
  Top 0.406: IC103.5 47.94,6.97 47.31,7.6 39.37,7.6 SV101.4 | IC104.14 42.86,19.66 44.13,20.93 44.13,24.75 38.42,30.46 v38.42,63.8
  Bottom 0.406: SV101.4 39.37,7.6 39.37,10.14 42.86,13.63 IC104.14 | v38.42,63.8 IC101.6
N$1  (via drill 0.5)
  Top 0.406: v32.38,13.32 29.84,13.32 28.26,14.9 IC105.1
  Bottom 0.406: IC104.1 53.02,21.25 52.07,20.3 38.73,20.3 36.51,18.08 36.51,13.95 35.88,13.32 v32.38,13.32
N$2  (via drill 0.5)
  Top 0.406: v29.21,12.04 v32.38,12.04 | v50.48,18.71 IC104.2
  Bottom 0.406: IC105.4 20.64,15.22 21.59,14.27 26.99,14.27 v29.21,12.04 | v32.38,12.04 37.15,12.04 39.05,13.95 39.05,18.08 39.69,18.71 v50.48,18.71
N$3
  Bottom 0.406: Q302.2 100.01,89.52 R302.2
N$4
  Top 0.406: OK101.3 29.84,51.41 R108.1
N$5
  Bottom 0.406: Q302.3 103.5,89.2 101.92,90.79 D316.C
N$6
  Bottom 0.813: C107.+ 44.77,87.93 33.34,87.93 | 33.34,87.93 D102.C 28.57,87.93 27.3,86.66 V101.IN | C106.1 33.34,87.93
N$7
  Top 0.406: R109.2 19.68,53.95 OK101.1
  Bottom 0.61: OK101.1 4.13,53.95 1.59,51.41 1.59,11.09 3.81,8.87 7.56,8.87 X101.3
N$8
  Bottom 0.406: RN301.3 74.93,88.56 77.15,90.79 D316.A
N$9
  Bottom 0.406: D101.AR 8.57,74.59 11.75,71.42 R104.2
N$10
  Bottom 0.406: Q303.2 100.01,83.48 R303.2
N$11
  Bottom 0.406: Q303.3 103.5,83.17 101.92,84.75 D317.C
N$12
  Bottom 0.406: RN301.5 73.66,83.48 74.93,84.75 D317.A
N$13
  Bottom 0.406: D101.AG 8.89,79.67 10.79,77.77 10.79,75.23 11.75,74.28 R105.2
N$14
  Bottom 0.406: Q304.2 100.01,77.45 R304.2
N$15  (via drill 0.5)
  Top 0.406: v85.41,52.05 85.41,55.86 86.04,56.49 88.9,56.49 90.17,57.76 95.25,57.76 v96.84,56.18
  Bottom 0.406: IC201.9 v85.41,52.05 | v96.84,56.18 117.79,56.18 119.06,57.45 LED203.K
N$16
  Bottom 0.406: Q304.3 103.5,77.13 101.92,78.72 D318.C
N$17
  Bottom 0.406: RN301.7 71.75,78.4 74.61,81.26 84.14,81.26 86.68,78.72 D318.A
N$18
  Bottom 0.406: Q305.2 100.01,71.42 R305.2
N$19
  Bottom 0.406: Q305.3 103.5,71.1 101.92,72.69 D319.C
N$20
  Bottom 0.406: D319.A 71.12,72.69 RN302.1
N$21
  Bottom 0.406: Q306.2 100.01,65.39 R306.2
N$22
  Bottom 0.406: Q306.3 103.5,65.07 101.92,66.66 D320.C
N$23
  Bottom 0.406: RN302.3 71.12,67.29 72.39,68.56 86.36,68.56 D320.A
N$24
  Bottom 0.406: Q307.2 100.01,59.35 R307.2
N$25
  Bottom 0.406: Q307.3 103.5,59.03 101.92,60.62 D321.C
N$26
  Bottom 0.406: RN302.5 71.12,62.21 72.39,63.48 85.41,63.48 D321.A
N$27
  Bottom 0.406: Q301.2 100.01,95.55 R301.2
N$28
  Bottom 0.406: Q308.2 100.01,53.32 R308.2
N$29
  Bottom 0.406: Q308.3 103.5,53 101.92,54.59 D334.C
N$30
  Bottom 0.406: RN302.7 71.12,57.13 72.39,55.86 87,55.86 D334.A
N$31  (via drill 0.5)
  Top 0.406: v90.17,51.73 94.61,51.73 v96.2,50.14 | v118.75,50.78 118.75,59.67 LED211.K
  Bottom 0.406: IC201.10 86.04,54.59 87.31,53.32 88.58,53.32 v90.17,51.73 | v96.2,50.14 118.11,50.14 v118.75,50.78
N$32
  Bottom 0.406: Q309.2 100.01,47.29 R309.2
N$33
  Bottom 0.406: Q301.3 103.5,95.23 101.92,96.82 D315.C
N$34
  Bottom 0.406: Q309.3 103.5,46.97 101.92,48.56 D335.C
N$35
  Bottom 0.406: RN303.1 70.8,52.68 71.44,53.32 86.04,53.32 86.68,52.68 86.68,49.19 87.31,48.56 D335.A
N$36
  Bottom 0.406: Q310.2 100.01,41.25 R310.2
N$37
  Bottom 0.406: Q310.3 103.5,40.94 101.92,42.52 D336.C
N$38
  Bottom 0.406: RN301.1 78.11,93.64 78.74,93.01 84.45,93.01 D315.A
N$39
  Bottom 0.406: RN303.3 72.07,44.75 86.04,44.75 D336.A
N$40
  Bottom 0.406: Q311.2 100.01,35.22 R311.2
N$41
  Bottom 0.406: Q311.3 103.5,34.9 101.92,36.49 D337.C
N$42
  Bottom 0.406: RN303.5 71.12,40.94 72.39,39.67 85.09,39.67 D337.A
N$43
  Bottom 0.406: Q312.2 100.01,29.19 R312.2
N$44
  Bottom 0.406: Q312.3 103.5,28.87 101.92,30.46 D338.C
N$45  (via drill 0.5)
  Top 0.406: v84.77,34.59 86.68,32.68 86.68,30.78 87,30.46 D338.A
  Bottom 0.406: RN303.7 72.07,34.59 v84.77,34.59
N$46
  Bottom 0.406: Q313.2 100.01,23.16 R313.2
N$47
  Bottom 0.406: Q313.3 103.5,22.84 101.92,24.43 D339.C
N$48
  Bottom 0.406: RN304.1 72.07,29.82 72.39,29.51 85.72,29.51 86.68,28.55 86.68,26.02 D339.A
N$49  (via drill 0.5)
  Top 0.406: v78.74,38.4 80.01,39.67 85.09,39.67 86.68,38.08 103.82,38.08 v104.46,38.71 | LED205.K 120.33,40.3 119.7,40.94 119.7,44.75 v119.06,45.38 | v111.44,45.38 v111.44,42.21
  Bottom 0.406: IC202.4 v78.74,38.4 | v119.06,45.38 117.16,47.29 113.35,47.29 v111.44,45.38 | v111.44,42.21 110.17,40.94 105.09,40.94 104.78,40.62 104.78,39.03 v104.46,38.71
N$50  (via drill 0.5)
  Top 0.406: v77.47,62.21 77.47,70.78 78.42,71.73 v82.55,71.73 | v85.09,71.73 v85.09,92.37
  Bottom 0.406: IC201.4 v77.47,62.21 | v82.55,71.73 v85.09,71.73 | v85.09,92.37 120.97,92.37 LED201.K
N$51  (via drill 0.5)
  Top 0.406: LED209.K 119.7,87.93 v118.11,86.34 | v86.04,86.34 v86.04,60.94
  Bottom 0.406: v118.11,86.34 v86.04,86.34 | v86.04,60.94 77.15,60.94 75.88,59.67 IC201.5
N$52  (via drill 0.5)
  Top 0.406: LED202.K 120.65,82.85 v118.11,80.31
  Bottom 0.406: v118.11,80.31 91.12,80.31 90.17,79.36 90.17,59.67 89.53,59.03 87.63,59.03 87,58.4 77.15,58.4 75.88,57.13 IC201.6
N$53  (via drill 0.5)
  Top 0.406: LED210.K 121.28,77.77 v117.79,74.28 | v91.12,50.14 v85.41,50.14 | v77.47,48.56 v77.47,54.59
  Bottom 0.406: v117.79,74.28 91.76,74.28 91.12,73.64 v91.12,50.14 | v85.41,50.14 83.19,50.14 81.6,48.56 v77.47,48.56 | v77.47,54.59 IC201.7
N$54  (via drill 0.5)
  Top 0.406: v89.85,56.18 v93.03,56.18 | v93.03,62.21 v107,62.21 | v118.43,62.84 118.43,64.43 LED204.K
  Bottom 0.406: IC201.11 87,57.13 87.95,56.18 v89.85,56.18 | v93.03,56.18 v93.03,62.21 | v107,62.21 117.79,62.21 v118.43,62.84
N$55  (via drill 0.5)
  Top 0.406: v85.09,59.67 v85.09,69.83 | v88.9,68.24 v107.31,68.24 | v118.43,69.2 118.43,71.1 120.02,72.69 LED212.K
  Bottom 0.406: IC201.12 v85.09,59.67 | v85.09,69.83 86.36,69.83 87.95,68.24 v88.9,68.24 | v107.31,68.24 117.47,68.24 v118.43,69.2
N$56  (via drill 0.5)
  Top 0.406: LED207.K 121.28,4.74 118.11,7.92 v116.2,7.92 | v82.87,16.17 82.87,27.92 82.55,28.24 IC202.9
  Bottom 0.406: v116.2,7.92 86.36,7.92 84.14,10.14 84.14,14.9 v82.87,16.17
N$57  (via drill 0.5)
  Top 0.406: LED213.K 120.97,35.22 119.7,36.49 119.7,38.4 118.43,39.67 118.43,43.16 117.47,44.11 v116.2,44.11 | v77.47,42.21 v77.47,35.86
  Bottom 0.406: v116.2,44.11 93.66,44.11 90.49,40.94 85.41,40.94 84.14,42.21 v77.47,42.21 | v77.47,35.86 IC202.5
N$58  (via drill 0.5)
  Top 0.406: v79.38,33.32 v79.38,37.13 | v117.79,38.08 118.11,38.08 118.75,37.45 118.75,33 LED206.K
  Bottom 0.406: IC202.6 v79.38,33.32 | v79.38,37.13 84.14,37.13 86.36,34.9 93.03,34.9 96.2,38.08 103.5,38.08 103.82,37.76 105.09,37.76 105.41,38.08 v117.79,38.08
N$59  (via drill 0.5)
  Top 0.406: LED214.K 120.65,25.06 119.38,26.33 119.38,28.24 118.43,29.19 118.43,31.41 117.79,32.05 v116.2,32.05
  Bottom 0.406: v116.2,32.05 78.11,32.05 76.83,30.78 IC202.7
N$60  (via drill 0.5)
  Top 0.406: LED215.K 117.47,13.95 v116.2,13.95 | v83.82,18.08 83.82,30.14 83.19,30.78 IC202.10
  Bottom 0.406: v116.2,13.95 87.95,13.95 v83.82,18.08
N$61  (via drill 0.5)
  Top 0.406: LED208.K 120.02,14.9 119.38,15.54 119.38,18.39 117.79,19.98 v116.2,19.98 | v88.58,19.98 85.09,19.98 84.77,20.3 84.77,31.73 83.19,33.32 IC202.11
  Bottom 0.406: v116.2,19.98 v88.58,19.98
N$62  (via drill 0.5)
  Top 0.406: LED216.K 120.33,19.98 118.75,21.57 118.75,25.06 117.79,26.02 v116.2,26.02 | v88.58,26.02 86.36,26.02 85.72,26.65 85.72,31.73 83.82,33.63 83.82,35.22 83.19,35.86 IC202.12
  Bottom 0.406: v116.2,26.02 v88.58,26.02
N$63
  Bottom 0.406: Q314.2 100.01,17.12 R314.2
N$64
  Bottom 0.406: Q314.3 103.5,16.81 101.92,18.39 D346.C
N$65
  Bottom 0.406: RN304.3 72.07,24.75 73.34,26.02 83.82,26.02 86.36,23.48 86.36,20.3 D346.A
N$66
  Bottom 0.406: Q315.2 100.01,11.09 R315.2
N$67
  Bottom 0.406: Q315.3 103.5,10.78 101.92,12.36 D347.C
N$68
  Bottom 0.406: RN304.5 72.71,19.66 74.3,18.08 82.55,18.08 D347.A
N$69
  Bottom 0.406: Q316.2 100.01,5.06 R316.2
N$70
  Bottom 0.406: Q316.3 103.5,4.74 101.92,6.33 D348.C
N$71
  Bottom 0.406: RN304.7 72.39,14.59 74.3,16.49 81.28,16.49 83.19,14.59 83.19,9.51 86.36,6.33 D348.A
OUT1
  Top 0.406: D308.C 105.73,93.96 104.14,95.55 103.19,95.55 101.92,94.28 101.28,94.28 100.01,95.55 89.85,95.55 R301.1
  Bottom 0.813: X302.1 127.95,95.55 126.68,96.82 D301.A 112.39,96.82 109.54,93.96 D308.C
OUT2
  Top 0.406: D309.C 105.73,87.93 104.14,89.52 103.19,89.52 101.92,88.25 101.28,88.25 100.01,89.52 89.85,89.52 R302.1
  Bottom 0.813: X302.2 127.95,90.47 124.14,86.66 120.02,86.66 118.75,87.93 118.75,88.56 D302.A 112.39,90.79 109.54,87.93 D309.C
OUT3
  Top 0.406: D310.C 105.73,81.9 104.14,83.48 103.19,83.48 101.92,82.21 101.28,82.21 100.01,83.48 89.85,83.48 R303.1
  Bottom 0.813: X302.3 127.95,85.39 124.14,81.58 119.7,81.58 D303.A 112.39,84.75 109.54,81.9 D310.C
OUT4
  Top 0.406: D311.C 105.73,75.86 104.14,77.45 103.19,77.45 101.92,76.18 101.28,76.18 100.01,77.45 89.85,77.45 R304.1
  Bottom 0.813: X302.4 127.95,80.31 124.14,76.5 118.75,76.5 D304.A 112.39,78.72 109.54,75.86 D311.C
OUT5
  Top 0.406: D312.C 105.73,69.83 104.14,71.42 103.19,71.42 101.92,70.15 101.28,70.15 100.01,71.42 89.85,71.42 R305.1
  Bottom 0.813: X302.5 127.95,75.23 124.14,71.42 117.79,71.42 D305.A 112.39,72.69 109.54,69.83 D312.C
OUT6
  Top 0.406: D313.C 105.73,63.8 104.14,65.39 103.19,65.39 101.92,64.12 101.28,64.12 100.01,65.39 89.85,65.39 R306.1
  Bottom 0.813: X302.6 127.95,70.15 124.14,66.34 116.84,66.34 D306.A 112.39,66.66 109.54,63.8 D313.C
OUT7
  Top 0.406: D314.C 105.73,57.76 104.14,59.35 103.19,59.35 101.92,58.08 101.28,58.08 100.01,59.35 89.85,59.35 R307.1
  Bottom 0.813: X302.7 127.64,65.07 123.83,61.26 117.16,61.26 D307.A 112.08,60.62 109.22,57.76 D314.C
OUT8
  Top 0.406: D328.C 106.05,51.73 104.46,53.32 103.19,53.32 101.92,52.05 101.28,52.05 100.01,53.32 89.85,53.32 R308.1
  Bottom 0.813: X302.8 127,59.99 121.6,54.59 D322.A 112.08,54.59 109.22,51.73 D328.C
OUT9
  Top 0.406: D329.C 105.73,45.7 104.14,47.29 103.19,47.29 101.92,46.02 101.28,46.02 100.01,47.29 89.85,47.29 R309.1
  Bottom 0.813: X303.1 127,40.3 118.75,48.56 D323.A 112.08,48.56 109.22,45.7 D329.C
OUT10
  Top 0.406: D330.C 105.73,39.67 104.14,41.25 103.19,41.25 101.92,39.98 101.28,39.98 100.01,41.25 89.85,41.25 R310.1
  Bottom 0.813: X303.2 127.95,35.22 124.14,39.03 120.02,39.03 D324.A 114.62,42.52 111.76,39.67 D330.C
OUT11
  Top 0.406: D331.C 106.05,33.63 104.46,35.22 103.19,35.22 101.92,33.95 101.28,33.95 100.01,35.22 89.85,35.22 R311.1
  Bottom 0.813: X303.3 127.95,30.14 124.14,33.95 119.06,33.95 D325.A 112.08,36.49 109.22,33.63 D331.C
OUT12
  Top 0.406: D332.C 105.73,27.6 104.14,29.19 103.19,29.19 101.92,27.92 101.28,27.92 100.01,29.19 89.85,29.19 R312.1
  Bottom 0.813: X303.4 127.95,25.06 124.14,28.87 118.11,28.87 D326.A 112.08,30.46 109.22,27.6 D332.C
OUT13
  Top 0.406: D333.C 105.73,21.57 104.14,23.16 103.19,23.16 101.92,21.89 101.28,21.89 100.01,23.16 89.85,23.16 R313.1
  Bottom 0.813: X303.5 127.95,19.98 124.14,23.79 117.16,23.79 D327.A 112.39,24.43 109.54,21.57 D333.C
OUT14
  Top 0.406: D343.C 105.73,15.54 104.14,17.12 103.19,17.12 101.92,15.86 101.28,15.86 100.01,17.12 89.85,17.12 R314.1
  Bottom 0.813: X303.6 127.95,14.9 124.14,18.71 116.84,18.71 D340.A 112.39,18.39 109.54,15.54 D343.C
OUT15
  Top 0.406: D344.C 105.73,9.51 104.14,11.09 103.19,11.09 101.92,9.82 101.28,9.82 100.01,11.09 89.85,11.09 R315.1
  Bottom 0.813: X303.7 127.95,9.82 124.14,13.63 117.79,13.63 D341.A 111.76,12.36 108.9,9.51 D344.C
OUT16
  Top 0.406: D345.C 105.73,3.47 104.14,5.06 103.19,5.06 101.92,3.79 101.28,3.79 100.01,5.06 89.85,5.06 R316.1
  Bottom 0.813: X303.8 127.95,4.74 124.14,8.55 118.75,8.55 D342.A 111.76,6.33 108.9,3.47 D345.C
PLUGGED  (via drill 0.5)
  Top 0.406: v13.34,76.5 v13.34,73.01 | v40.01,73.96 IC101.39
  Bottom 0.406: CON101.3 10.65,79.18 v13.34,76.5 | v13.34,73.01 31.11,73.01 31.43,72.69 38.73,72.69 v40.01,73.96
Q-CLK
  Top 0.61: IC101.13 33.02,46.02 30.8,43.79 30.8,28.24 | 30.8,28.24 QG101.8 | 30.8,28.24 30.8,27.6 32.38,26.02 34.29,26.02 35.24,25.06 IC104.8
SCK  (via drill 0.5)
  Top 0.406: IC103.6 50.48,7.6 49.21,8.87 45.72,8.87 44.13,10.46 38.42,10.46 38.1,10.14 SV101.3 | IC104.13 40.32,19.66 41.59,20.93 41.59,24.75 37.47,28.87 v37.47,58.72
  Bottom 0.406: SV101.3 38.1,11.09 40.32,13.32 IC104.13 | v37.47,58.72 IC101.8
SCL  (via drill 0.5)
  Top 0.406: IC202.14 79.69,40.94 78.74,41.89 v78.74,47.29 v78.74,64.75
  Bottom 0.406: IC101.22 52.39,30.78 53.66,29.51 R201.1 56.2,28.55 64.45,28.55 65.09,29.19 65.09,46.65 65.72,47.29 v78.74,47.29 | v78.74,64.75 IC201.14
SDA  (via drill 0.5)
  Top 0.406: v79.69,43.48 v79.69,49.83 79.69,66.66 80.33,67.29 IC201.15
  Bottom 0.406: IC101.23 R202.1 53.66,31.73 62.87,31.73 64.14,33 64.14,48.24 65.72,49.83 v79.69,49.83 | IC202.15 v79.69,43.48
SPG
  Bottom 0.61: R106.2 R107.1 44.77,78.72 46.99,76.5 IC101.40
V+
  Top 0.813: OK201.7 65.72,91.1 65.09,90.47 65.09,86.02 | 65.09,86.02 65.09,80.94 | 65.09,80.94 65.09,75.86 | 65.09,75.86 65.09,69.83 | 65.09,69.83 65.09,64.75 | 65.09,64.75 65.09,59.67 | 65.09,59.67 65.09,54.59 | 65.09,54.59 65.09,48.56 | 65.09,48.56 65.09,43.48 | 65.09,43.48 65.09,38.08 | 65.09,38.08 65.09,33.32 | 65.09,33.32 65.09,27.29 | 65.09,27.29 65.09,22.21 | 65.09,22.21 65.09,16.81 | 65.09,16.81 65.09,12.04 | 65.09,12.04 65.09,9.82 65.72,9.19 74.3,9.19 75.88,7.6 DC201.4 | 65.09,12.04 OK204.1 | OK204.3 65.41,17.12 65.09,16.81 | 65.09,22.21 OK204.5 | 65.09,27.29 OK204.7 | OK203.3 65.41,38.4 65.09,38.08 | 65.09,43.48 OK203.5 | 65.09,48.56 OK203.7 | 65.09,59.67 OK202.3 | 65.09,64.75 OK202.5 | 65.09,69.83 OK202.7 | 65.09,75.86 OK201.1 | 65.09,80.94 OK201.3 | 65.09,86.02 OK201.5 | 65.09,54.59 OK202.1 | 65.09,33.32 OK203.1
  Bottom 0.813: C201.1 76.83,12.04 75.88,11.09 DC201.4
V-NETZTEIL1
  Bottom 1.27: CON101.1 19.05,90.47 21.91,93.33 D103.A

## Text on the board
tNames: HW: 23.11.25 | 1 | 2 | +18V | DC | 3 | Status | 4 | 5 | 6 | (c) Dr.-Ing. Th. Wiesner | MBCAN-Projekt | 7 | 8 | 0 | Booster | B | 9 | IN | 10 | 11 | 12 | 13 | OUT | 14 | 15 | 16 | mbc-90-DC